# Altium schematic sheet Sheet_1_2026-10-04.schdoc
size 349 x 304 mm
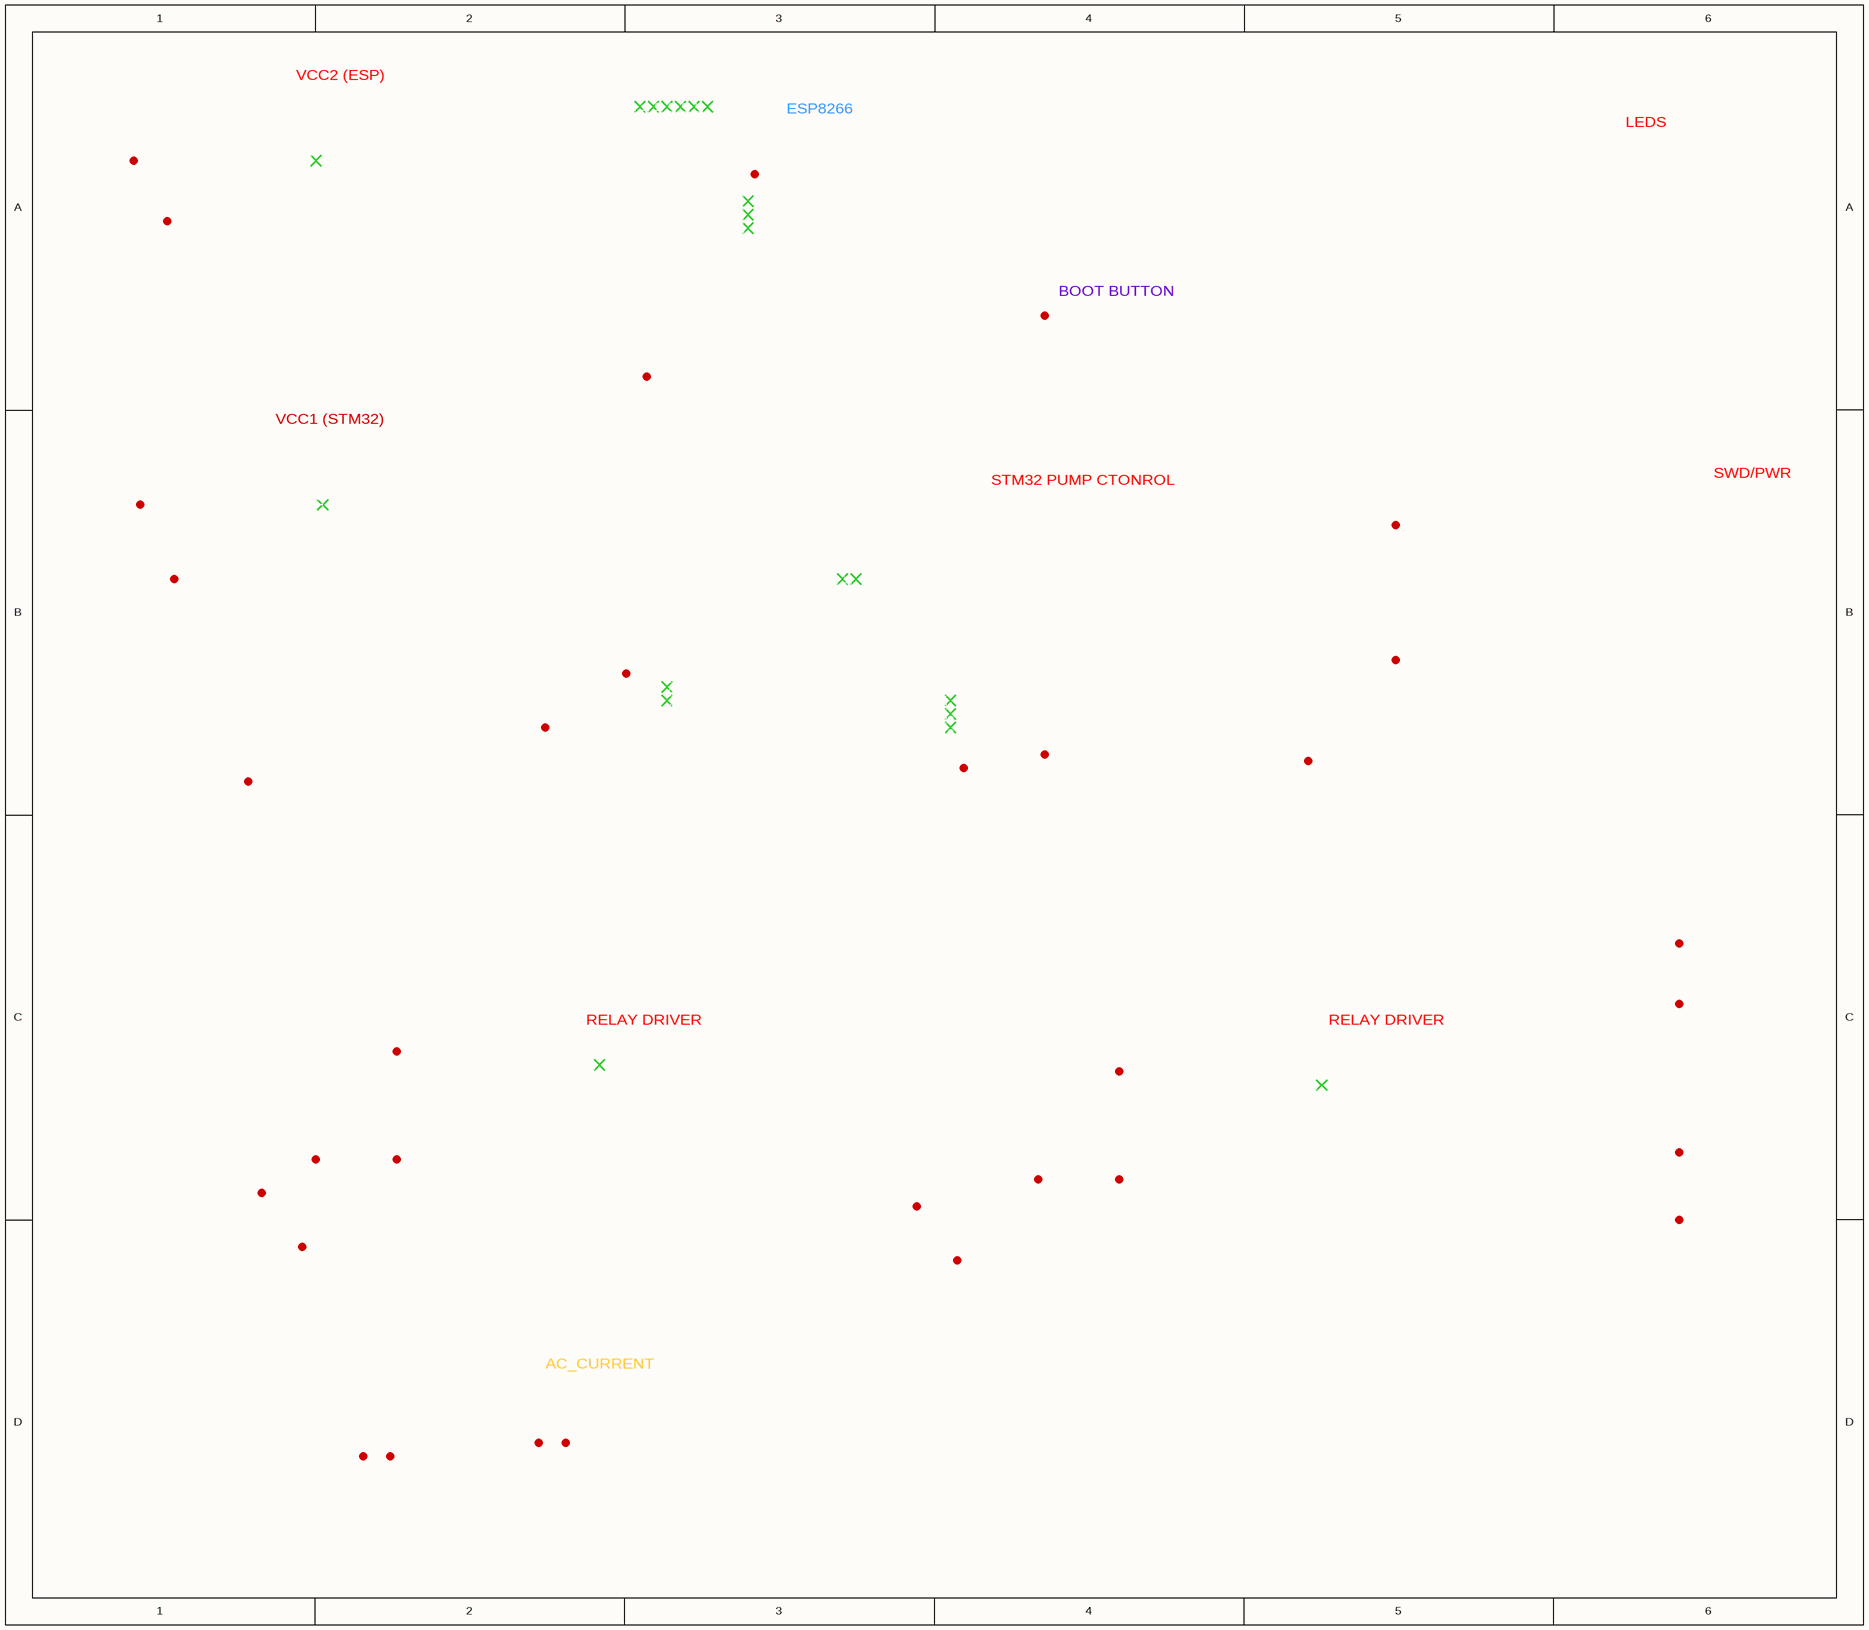
[diagram p0: Sheet_1_2026-10-04.schdoc]

## Parts
C1  22u  [C0603]
C2  10u  [C0603]
C3  10u  [C0603]
C4  22u  [C0603]
C5  100nF  [C0603]
C6  100nF  [C0603]
C7  0.1uF  [C0603]
C8  100nF  [C0603]
C9  470uF  [CAP-TH_BD8.0-P3.50-D0.5-FD_470UF25VF140KM]
C10  100nF  [C0603]
C11  100nF  [C0603]
CN1  ZX-XH2.54-4PWZ-GW  [CONN-TH_4P-P2.50_ZX-XH2.54-4PWZ-Y]
CN2  ZX-XH2.54-4PWZ-GW  [CONN-TH_4P-P2.50_ZX-XH2.54-4PWZ-Y]
CN3  ZX-XH2.54-4PWZ-GW  [CONN-TH_4P-P2.50_ZX-XH2.54-4PWZ-Y]
D2  1N4007W A7  [SOD-123_L2.8-W1.8-LS3.7-RD-3]
D3  1N4007W A7  [SOD-123_L2.8-W1.8-LS3.7-RD-3]
H1  HDR-F-2.54_1x2  [HDR-F-2.54_1X2]
H2  HDR-F-2.54_1x2  [HDR-F-2.54_1X2]
H3  HDR-F-2.54_1x2  [HDR-F-2.54_1X2]
J1  HDR-M-2.54_1x1  [HDR-M-2.54_1X1]
J2  GND  [HDR-M-2.54_1X1]
J3  +5V  [HDR-M-2.54_1X1]
J5  HDR-M-2.54_1x1  [HDR-M-2.54_1X1]
J6  HDR-M-2.54_1x1  [HDR-M-2.54_1X1]
J7  HDR-M-2.54_1x1  [HDR-M-2.54_1X1]
J8  HDR-M-2.54_1x1  [HDR-M-2.54_1X1]
J11  GND  [HDR-M-2.54_1X1]
J14  +5V  [HDR-M-2.54_1X1]
K1  SRD-48VDC-SL-C  [RELAY-TH_SRD-48VDC-SL-C]
K3  SRD-48VDC-SL-C  [RELAY-TH_SRD-48VDC-SL-C]
KEY1  silent key button  [KEY-SMD_L6.0-W6.0-LS6.6]
P1  WJ126V-5.0-2P  [CONN-TH_WJ126V-5.0-2P]
P3  WJ126V-5.0-2P  [CONN-TH_WJ126V-5.0-2P]
Q1  PMBT3904  [SOT-23-3_L2.9-W1.3-P1.90-LS2.4-BR]
Q3  AO3400-ES  [SOT-23-3_L2.9-W1.3-P1.90-LS2.4-BR]
Q4  AO3400-ES  [SOT-23-3_L2.9-W1.3-P1.90-LS2.4-BR]
R1  10K  [R0603]
R2  10K  [R0603]
R3  10K  [R0603]
R4  10k  [R0603]
R5  10K  [R0603]
R6  10K  [R0603]
R7  200R  [R0603]
R8  10K  [R0603]
R9  10K  [R0603]
R10  200R  [R0603]
R12  4.7K  [R0603]
R13  4.7K  [R0603]
R14  10K  [R0603]
R15  10K  [R0603]
R16  100R  [R0603]
R17  200R  [R0603]
R18  100R  [R0603]
R19  10k  [R0603]
R20  10K  [R0603]
R21  10K  [R0603]
R22  10K  [R0603]
R23  10K  [R0603]
RR1  3K  [R0603]
RR2  2K  [R0603]
RR3  10K  [R0603]
RR4  3K  [R0603]
RR5  2K  [R0603]
RR6  10K  [R0603]
RR7  10R  [R0603]
RR8  10R  [R0603]
RR9  10K  [R0603]
U1  WT8266-S5 ESP-12F_C784365  [WIRELM-SMD_WT8266-S5-ESP-12F]
U2  AMS1117A-ADJ  [SOT-223_L6.3-W3.5-P2.30-LS7.0-BR]
U3  STM32F042K6T6  [LQFP-32_L7.0-W7.0-P0.80-LS9.0-BL]
U4  AMS1117A-ADJ  [SOT-223_L6.3-W3.5-P2.30-LS7.0-BR]
U5  LED05  [LED-TH_LED-3MM_RED]
U6  LED05  [LED-TH_LED-3MM_RED]
U9  DS18B20  [TO-92-3_L4.9-W3.7-P2.54-L]
U10  LED05  [LED-TH_LED-3MM_RED]
U13  DS18B20  [TO-92-3_L4.9-W3.7-P2.54-L]

## Blocks framed on the sheet
VCC2 (ESP): C1 C2 J11 U2
ESP8266: C9 U1
LEDS: R7 R10 R17 U5 U6 U10
BOOT BUTTON: KEY1 RR6
VCC1 (STM32): C3 C4 J2 J3 U4
STM32 PUMP CTONROL: C5 C6 C11 H2 R3 RR3 U3
SWD/PWR: J5-J8 J14 R6
RELAY DRIVER: C10 D3 K1 P3 Q4 R18 R19 RR8
RELAY DRIVER: C8 D2 K3 P1 Q3 R4 R16 RR7
GND: CN3 R14 R15

## Ports
3v3_1 (in), 3V3_1 (in), 3v3_2 (in), 3V3_2 (in), bootBTN (in), BTN1_RSTERR (in), current1 (in), current2 (in), ESP_RST (in), ESP_RX (in), ESP_TX (in), GND10K_1 (in), LED_RUN1 (in), LED_RUN2 (in), LED_WiFi (in), NRST (in), OneWire (in), pump1_ctrl (in), pump2_ctrl (in), SCL2 (in), SCL (in), SDA2 (in), SDA (in), SWCLK (in), SWDIO (in), TM163_CLK (in), TM163_DIO (in), VBAT_ADC (in), vcc10K_1 (in), vcc10K_2 (in), vcc10K_3 (in)

## Nets
+5V: C2.1 C3.1 C8.1 C10.1 CN1.3 D2.1(C) D3.1(C) J3.1 J14.1 K1.5 K3.5 U2.3(VIN) U4.3(VIN)
GND: C1.2 C2.2 C3.2 C4.2 C5.2 C6.2 C7.2 C9.2 C11.2 CN2.1 CN3.1 H2.2 H3.2 J2.1 J8.1 J11.1 KEY1.1 Q1.2(E) Q3.2(S) Q4.2(S) R3.1 R4.1 R9.1 R19.1 R21.1 RR1.1 RR4.1 U1.9(GND) U2.1(GND) U3.16(VSS) U3.32(VSS) U4.1(GND) U5.2 U6.2 U9.1(GND) U10.2 U13.1(GND)
VCC: RR3.1 RR6.1 RR9.1
3v3_1: C4.1 C5.1 C6.1 C11.1 CN2.2 U3.1(VDD) U3.5(VDDA) U3.17(VDDIO2) U4.2(VOUT) ; port 3v3_1, port 3V3_1
3v3_2: C1.1 C9.1 CN3.2 R2.2 R5.2 R6.2 R8.2 R14.2 R15.2 R22.1 R23.2 U1.8(VCC) U2.2(VOUT) ; port 3v3_2, port 3V3_2
bootBTN: KEY1.2 RR6.2 U1.12(IO0) ; port bootBTN
BTN1_RSTERR: H3.1 RR9.2 U3.19(PA9) ; port BTN1_RSTERR
current1: RR1.2 RR5.2 U3.14(PB0) ; port current1
current2: RR2.2 RR4.2 U3.15(PB1) ; port current2
ESP_RST: R1.2 U3.13(PA7) ; port ESP_RST
ESP_RX: U1.16(TXD0) U3.8(PA2) ; port ESP_RX
ESP_TX: U1.15(RXD0) U3.9(PA3) ; port ESP_TX
GND10K_1: R9.2 U1.10(IO15) ; port GND10K_1
LED_RUN1: R10.2 U3.11(PA5) ; port LED_RUN1
LED_RUN2: R17.2 U3.12(PA6) ; port LED_RUN2
LED_WiFi: R7.2 U1.7(IO13) ; port LED_WiFi
NRST: J7.1 R6.1 U3.4(NRST) ; port NRST
OneWire: R12.1 R13.1 U3.10(PA4) U9.2(DQ) U13.2(DQ) ; port OneWire
pump1_ctrl: RR8.1 U3.27(PB4) ; port pump1_ctrl
pump2_ctrl: RR7.1 U3.28(PB5) ; port pump2_ctrl
SCL: CN2.4 R23.1 U3.29(PB6) ; port SCL
SCL2: CN3.4 R14.1 U1.14(IO5) ; port SCL2
SDA: CN2.3 R22.2 U3.30(PB7) ; port SDA
SDA2: CN3.3 R15.1 U1.13(IO4) ; port SDA2
SWCLK: J5.1 U3.24(PA14) ; port SWCLK
SWDIO: J6.1 U3.23(PA13) ; port SWDIO
TM163_CLK: H1.1 U3.6(PA0) ; port TM163_CLK
TM163_DIO: H1.2 U3.7(PA1) ; port TM163_DIO
VBAT_ADC: R20.1 R21.2 U1.2(ADC) ; port VBAT_ADC
vcc10K_1: R8.1 U1.11(IO2) ; port vcc10K_1
vcc10K_2: Q1.3(C) R5.1 U1.1(RST) ; port vcc10K_2
vcc10K_3: R2.1 U1.3(EN) ; port vcc10K_3
NetC7_1: C7.1 CN1.4
NetC8_2: C8.2 R16.2
NetC10_2: C10.2 R18.2
NetCN1_1: CN1.1 RR5.1
NetCN1_2: CN1.2 RR2.1
NetD2_2: D2.2(A) K3.1 Q3.3(D) R16.1
NetD3_2: D3.2(A) K1.1 Q4.3(D) R18.1
NetH2_1: H2.1 RR3.2 U3.18(PA8)
NetJ1_1: J1.1 R20.2
NetK1_2: K1.2 P3.1
NetK1_3: K1.3 P3.2
NetK3_2: K3.2 P1.1
NetK3_3: K3.3 P1.2
NetQ1_1: Q1.1(B) R1.1
NetQ3_1: Q3.1(G) R4.2 RR7.2
NetQ4_1: Q4.1(G) R19.2 RR8.2
NetR3_2: R3.2 U3.31(PB8/BOOT0)
NetR7_1: R7.1 U5.1
NetR10_1: R10.1 U6.1
NetR12_2: R12.2 U13.3(VDD)
NetR13_2: R13.2 U9.3(VDD)
NetR17_1: R17.1 U10.1

Not connected (* = marked no-connect by the designer): K1 4*; K3 4*; U1 4(IO16)* 5(IO14)* 6(IO12)* 17(CS0)* 18(MISO)* 19(GPIO9)* 20(GPIO0)* 21(MOSI)* 22(SCLK)*; U2 4(VOUT)*; U3 2(PF0/OSC_IN)* 3(PF1/OSC_OUT)* 20(PA10)* 21(PA11)* 22(PA12)* 25(PA15)* 26(PB3)*; U4 4(VOUT)*

## Notes on the sheet
- AC_CURRENT
- GND

## Library data of the parts
C1 C4 = 22u: nameAlias: Value(F); Contributor: LCEDA_Lib; spicePre: C; spiceSymbolName: C_0603_US
C2 C3 = 10u: nameAlias: Value(F); Contributor: LCEDA_Lib; spicePre: C; spiceSymbolName: C_0603_US
C5 C6 C8 C10 C11 = 100nF: nameAlias: Value(F); Contributor: LCEDA_Lib; spicePre: C; spiceSymbolName: C_0603_US
C7 = 0.1uF: nameAlias: Value(F); Contributor: LCEDA_Lib; spicePre: C; spiceSymbolName: C_0603_US
C9 = 470uF: Manufacturer: Econd(米朗电子); Manufacturer Part: 470UF25VF140KM; nameAlias: Value; Contributor: lcsc; Supplier: LCSC; Supplier Part: C46867098; JLCPCB Part Class: Extended Part; spicePre: C; spiceSymbolName: 470UF25VF140KM
CN1-CN3 = ZX-XH2.54-4PWZ-GW: Manufacturer: Megastar(兆星); Contributor: lcsc; Supplier: LCSC; Supplier Part: C42441540; Manufacturer Part: ZX-XH2.54-4PWZ-GW; JLCPCB Part Class: Extended Part; spicePre: C; spiceSymbolName: ZX-XH2.54-4PWZ-GW
D2 D3 = 1N4007W A7: Manufacturer: JSMSEMI(杰盛微); Contributor: lcsc; Supplier: LCSC; Supplier Part: C2857183; Manufacturer Part: 1N4007W A7; JLCPCB Part Class: Extended Part; spicePre: D; spiceSymbolName: 1N4007W A7
H1-H3 = HDR-F-2.54_1x2: Contributor: LCEDA_Lib; Supplier Part: C49661; Supplier: LCSC; spicePre: H; spiceSymbolName: HDR-F-2.54_1x2
J1 J5-J8 = HDR-M-2.54_1x1: Contributor: LCEDA_Lib; Supplier Part: C81276; Supplier: LCSC; spicePre: J; spiceSymbolName: HDR-M-2.54_1x1
J2 J11 = GND: Contributor: LCEDA_Lib; Supplier Part: C81276; Supplier: LCSC; spicePre: J; spiceSymbolName: HDR-M-2.54_1x1
J3 J14 = +5V: Contributor: LCEDA_Lib; Supplier Part: C81276; Supplier: LCSC; spicePre: J; spiceSymbolName: HDR-M-2.54_1x1
K1 K3 = SRD-48VDC-SL-C: Manufacturer: 松乐; Contributor: LCSC; Supplier: LCSC; Supplier Part: C490149; Manufacturer Part: SRD-48VDC-SL-C; JLCPCB Part Class: Extended Part; spicePre: K; spiceSymbolName: SRD-48VDC-SL-C
KEY1 = silent key button: Manufacturer: ReliaPro; Manufacturer Part: 6*6*5 Silicone silent key button; Supplier Part: C61120; Supplier: LCSC; JLCPCB Part Class: Extended Part; spicePre: K; spiceSymbolName: 6*6*5 Silicone silent key button
P1 P3 = WJ126V-5.0-2P: Manufacturer: KANGNEX(康奈克斯电气); Supplier: LCSC; Manufacturer Part: WJ126V-5.0-2P; Supplier Part: C8404; JLCPCB Part Class: Extended Part; spicePre: P; spiceSymbolName: WJ126V-5.0-2P
Q1 = PMBT3904: Manufacturer: PAKER(派克微); Contributor: lcsc; Supplier: LCSC; Supplier Part: C5278868; Manufacturer Part: PMBT3904; JLCPCB Part Class: Extended Part; spicePre: Q; spiceSymbolName: PMBT3904
Q3 Q4 = AO3400-ES: Manufacturer: ElecSuper(静芯); Contributor: lcsc; Supplier: LCSC; Supplier Part: C41365197; Manufacturer Part: AO3400-ES; spicePre: Q; spiceSymbolName: AO3400-ES
R1-R3 R5 R6 R8 R9 R14 R15 R20-R23 RR3 RR6 RR9 = 10K: nameAlias: Value(Ω); Contributor: LCEDA_Lib; spicePre: R
  R1-R3 R5 R8 R9 R20 R21 RR3 RR6 RR9: spiceSymbolName: R_0603_EU
  R6 R14 R15 R22 R23: spiceSymbolName: R_0603_US
R4 R19 = 10k: nameAlias: Value(Ω); Contributor: LCEDA_Lib; spicePre: R; spiceSymbolName: R_0603_EU
R7 R10 R17 = 200R: nameAlias: Value(Ω); Contributor: LCEDA_Lib; spicePre: R; spiceSymbolName: R_0603_EU
R12 R13 = 4.7K: nameAlias: Value(Ω); Contributor: LCEDA_Lib; spicePre: R; spiceSymbolName: R_0603_EU
R16 R18 = 100R: nameAlias: Value(Ω); Contributor: LCEDA_Lib; spicePre: R; spiceSymbolName: R_0603_EU
RR1 RR4 = 3K: nameAlias: Value(Ω); Contributor: LCEDA_Lib; spicePre: R; spiceSymbolName: R_0603_EU
RR2 RR5 = 2K: nameAlias: Value(Ω); Contributor: LCEDA_Lib; spicePre: R; spiceSymbolName: R_0603_EU
RR7 RR8 = 10R: nameAlias: Value(Ω); Contributor: LCEDA_Lib; spicePre: R; spiceSymbolName: R_0603_EU
U1 = WT8266-S5 ESP-12F_C784365: Manufacturer: Wireless-tag(启明云端); Contributor: LCSC; Supplier: LCSC; Supplier Part: C784365; Manufacturer Part: WT8266-S5 ESP-12F; JLCPCB Part Class: Extended Part; spicePre: U; spiceSymbolName: WT8266-S5 ESP-12F_C784365
U2 U4 = AMS1117A-ADJ: Manufacturer: HX(恒佳兴); Contributor: lcsc; Supplier: LCSC; Supplier Part: C2984864; Manufacturer Part: AMS1117A-ADJ; JLCPCB Part Class: Extended Part; spicePre: U; spiceSymbolName: AMS1117A-ADJ
U3 = STM32F042K6T6: Manufacturer: ST(意法半导体); Supplier: LCSC; Manufacturer Part: STM32F042K6T6; Supplier Part: C69216; JLCPCB Part Class: Extended Part; spicePre: U; spiceSymbolName: STM32F042K6T6
U5 U6 U10 = LED05: Manufacturer: null; Manufacturer Part: LED05-红灯; Contributor: LCSC; Supplier: LCSC; Supplier Part: C9900009041; JLCPCB Part Class: Extended Part; spicePre: U; spiceSymbolName: LED05-红灯
U9 U13 = DS18B20: Manufacturer: ADI(亚德诺)/MAXIM(美信); Manufacturer Part: DS18B20+T&R; Contributor: LCSC; Supplier: LCSC; Supplier Part: C880672; JLCPCB Part Class: Extended Part; spicePre: U; spiceSymbolName: DS18B20+T&amp;R